# Altium project Francisco Gimenez.PrjPCB (part 3 of 3)

## Sheet Actuator_Section.SchDoc
size A; DocumentNumber: 10; SheetNumber: 10; SheetTotal: 13
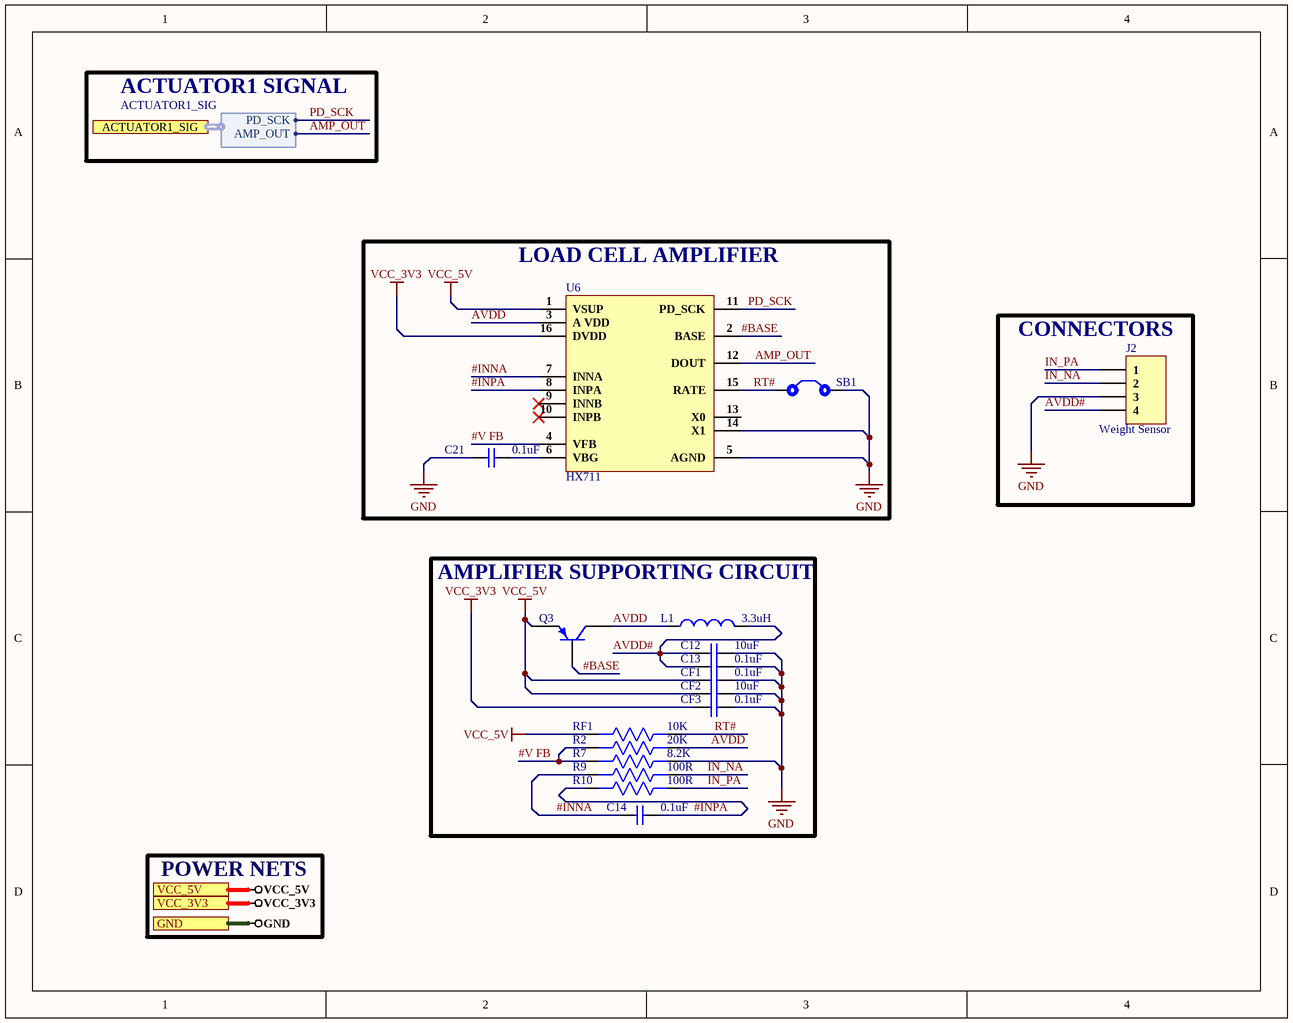
[diagram p8: Actuator_Section.SchDoc]

### Parts
C12  10uF  [CAP-0603]
C13  0.1uF  [CAP-0603]
C14  0.1uF  [CAP-0603]
C21  0.1uF  [CAP-0603]
CF1  0.1uF  [CAP-0603]
CF2  10uF  [CAP-0603]
CF3  0.1uF  [CAP-0603]
J2  Weight Sensor  [B4B-XH-A(LF)(SN)]
L1  3.3uH  [74437368033]
Q3  MMBT4403LT1G  [sot-23]  (value not drawn)
R2  20K  [RES-0603]
R7  8.2K  [RES-0603]
R9  100R  [RES-0603]
R10  100R  [RES-0603]
RF1  10K  [RES-0603]
SB1  Solder Bridge  [Solder Bridge]  (value not drawn)
U6  HX711  [HX711]

### Blocks framed on the sheet
LOAD CELL AMPLIFIER: C21 SB1 U6
CONNECTORS: J2
AMPLIFIER SUPPORTING CIRCUIT: C12-C14 CF1-CF3 L1 Q3 R2 R7 R9 R10 RF1

### Ports
ACTUATOR1_SIG (harness ACTUATOR1_SIG), GND, VCC_3V3, VCC_5V

### Harnesses
ACTUATOR1_SIG: PD_SCK, AMP_OUT

### Nets
GND: C12.2 C13.2 C21.1 CF1.2 CF2.2 CF3.2 J2.3 R7.1 SB1.2 U6.5(AGND) U6.14(X1) ; port GND
VCC_3V3: CF3.1 U6.16(DVDD) ; port VCC_3V3
VCC_5V: CF1.1 CF2.1 Q3.2(E) RF1.2 U6.1(VSUP) ; port VCC_5V
#BASE: Q3.1(B) U6.2(BASE)
#INNA: C14.1 R9.2 U6.7(INNA)
#INPA: C14.2 R10.2 U6.8(INPA)
#V FB: R2.2 R7.2 U6.4(VFB)
AMP_OUT: U6.12(DOUT) ; port ACTUATOR1_SIG.AMP_OUT  [project net ACTUATOR1_SIG.AMP_OUT]
AVDD: L1.1 Q3.3(C) R2.1 U6.3(A_VDD)
AVDD#: C12.1 C13.1 J2.4 L1.2
IN_NA: J2.2 R9.1
IN_PA: J2.1 R10.1
PD_SCK: U6.11(PD_SCK) ; port ACTUATOR1_SIG.PD_SCK  [project net ACTUATOR1_SIG.PD_SCK]
RT#: RF1.1 SB1.1 U6.15(RATE)
NetC21_2: C21.2 U6.6(VBG)

Not connected (* = marked no-connect by the designer): U6 9(INNB)* 10(INPB)* 13(X0)

### Notes on the sheet
- ACTUATOR1 SIGNAL
- POWER NETS

### Library data of the parts
C12 CF2 = TMK107BBJ106MA-T: CAP CER 10UF 25V X5R 0603; Manufacturer: Taiyo Yuden; Tolerance: 20%; Supplier 1: Digi-Key; Manufacturer Part Number: TMK107BBJ106MA-T; Stock 1: 85333; Pricing 1: 1=0.46, 10=0.32, 50=0.2238, 100=0.1918, 500=0.14386, 1000=0.12149 (USD); Mount: Surface Mount; Case/Package: 0603; Case Code (Imperial): 0603; Case Code (Metric): 1608; Min Operating Temperature: -55°C; Max Operating Temperature: 85°C; Packaging: Tape and Reel; Capacitance: 10uF; Voltage Rating: 25V; Lead Free: Lead Free; RoHS Compliant: Yes; ComponentLink1URL: http://ds.yuden.co.jp/TYCOMPAS/ut/detail.do?productNo=TMK107BBJ106MA-T&fileName=TMK107BBJ106MA-T_SS&mode=specSheetDownload&src-supplier=Digi-Key; ComponentLink1Description: http://ds.yuden.co.jp/TYCOMPAS/ut/detail.do?productNo=TMK107BBJ106MA-T&fileName=TMK107BBJ106MA-T_SS&mode=specSheetDownload&src-supplier=Digi-Key; Supplier Part Number 1: 587-6023-1-ND
C13 C14 C21 CF1 CF3 = CL10B104KB8NNNL: CAP CER 0.1UF 50V X7R 0603; Manufacturer: Samsung; Capacitance: 100nF; Tolerance: 10%; Supplier 1: Digi-Key; Manufacturer Part Number: CL10B104KB8NNNL; Stock 1: 3731229; Pricing 1: 1=0.1, 10=0.03, 50=0.0164, 100=0.0134, 500=0.00958, 1000=0.00753, 2500=0.00684, 5000=0.0063 (USD); Mount: Surface Mount; Case/Package: 0603; Min Operating Temperature: -55°C; Max Operating Temperature: 125°C; Dielectric: X7R; Packaging: Tape and Reel; Package Quantity: 15000; Voltage Rating: 50V; Voltage Rating (DC): 50V; Series: CL; Construction: Flat; Length: 1.6mm; Width: 0.031inch; Height: 0.8mm; Thickness: 0.035inch; Depth: 0.8mm; Radiation Hardening: No; RoHS Compliant: Yes; ComponentLink1URL: https://www.verical.com/server-webapp/html/getDatasheet?partID=357523&src-supplier=Verical; ComponentLink1Description: https://www.verical.com/server-webapp/html/getDatasheet?partID=357523&src-supplier=Verical; ComponentLink2URL: https://media.digikey.com/pdf/Data%20Sheets/Samsung%20PDFs/CL_Series_MLCC_ds.pdf?src-supplier=Digi-Key; ComponentLink2Description: https://media.digikey.com/pdf/Data%20Sheets/Samsung%20PDFs/CL_Series_MLCC_ds.pdf?src-supplier=Digi-Key; Supplier Part Number 1: 1276-CL10B104KB8NNNLCT-ND
J2 = B4B-XH-A(LF)(SN): CONN HEADER VERT 4POS 2.5MM; Manufacturer: JST; Current Rating: 3A; Contact Resistance: 20mR; Voltage Rating (AC): 250V; Number of Positions: 4; Insulation Resistance: 1GR; Connector Type: Male Pin; Gender: Male; Wire/Cable Gauge: 22AWG; Supplier 1: Digi-Key; Manufacturer Part Number: B4B-XH-A(LF)(SN); Stock 1: 0; Mount: Through Hole; Contact Material: Brass; Contact Plating: Tin,Copper,Lead; Color: Natural; Housing Color: White; Housing Material: Polyamide; Material: Polyamide; Min Operating Temperature: -25°C; Max Operating Temperature: 85°C; Number of Rows: 1; Max Current Rating: 3A; Package Quantity: 500; Packaging: Bulk; Voltage Rating: 250V; Termination: Press-Fit; Max Voltage Rating (AC): 250V; Max Voltage Rating (DC): 250V; Number of Contacts: 4; Orientation: Straight; Series: XH; Contact Type: Male Pin; Length: 12.4mm; Pitch: 2.5mm; Lead Pitch: 2.5mm; Depth: 5.75mm; REACH SVHC: No SVHC; Lead Free: Lead Free; ComponentLink1URL: http://www.jst-mfg.com/product/pdf/eng/eXH.pdf?src-supplier=Digi-Key; ComponentLink1Description: http://www.jst-mfg.com/product/pdf/eng/eXH.pdf?src-supplier=Digi-Key; ComponentLink2URL: https://www.verical.com/server-webapp/html/getDatasheet?partID=640571&src-supplier=Verical; ComponentLink2Description: https://www.verical.com/server-webapp/html/getDatasheet?partID=640571&src-supplier=Verical; ComponentLink3URL: http://www.jst-mfg.com/product/pdf/eng/eXH.pdf?src-supplier=Future+Electronics; ComponentLink3Description: http://www.jst-mfg.com/product/pdf/eng/eXH.pdf?src-supplier=Future+Electronics; ComponentLink4URL: https://www.verical.com/server-webapp/html/getDatasheet?partID=455616&src-supplier=Verical; ComponentLink4Description: https://www.verical.com/server-webapp/html/getDatasheet?partID=455616&src-supplier=Verical; Supplier Part Number 1: 455-2249-ND
L1 = 74437368033: FIXED IND 3.3UH 8A 11.8 MOHM SMD; Manufacturer: Wurth Electronics; Core Material: Ferrite,Composite; Tolerance: 20%; Saturation Current: 23A; Shielding: Shielded; Self Resonant Frequency: 22MHz; DC Resistance (DCR): 11.8mR; Test Frequency: 100kHz; ComponentLink1URL: http://www.farnell.com/datasheets/1735871.pdf?src-supplier=Element14; ComponentLink1Description: http://www.farnell.com/datasheets/1735871.pdf?src-supplier=Element14; ComponentLink2URL: http://www.mouser.com/ds/2/445/74437368022-538992.pdf?src-supplier=Mouser; ComponentLink2Description: http://www.mouser.com/ds/2/445/74437368022-538992.pdf?src-supplier=Mouser; ComponentLink3URL: http://katalog.we-online.de/pbs/datasheet/74437368022.pdf?src-supplier=Digi-Key; ComponentLink3Description: http://katalog.we-online.de/pbs/datasheet/74437368022.pdf?src-supplier=Digi-Key; ComponentLink4URL: http://documents.rs-components.com/techlib://itc_doclist_GB.htm?stockno=7568629&src-supplier=RSComponents; ComponentLink4Description: http://documents.rs-components.com/techlib://itc_doclist_GB.htm?stockno=7568629&src-supplier=RSComponents; ComponentLink5URL: http://www.produktinfo.conrad.com/datenblaetter/1000000-1099999/001087607-da-01-ml-WE_LHMI_SMD_SPEICHERDROSSEL_744373_de_en.pdf?src-supplier=Conrad; ComponentLink5Description: http://www.produktinfo.conrad.com/datenblaetter/1000000-1099999/001087607-da-01-ml-WE_LHMI_SMD_SPEICHERDROSSEL_744373_de_en.pdf?src-supplier=Conrad; Supplier 1: Digi-Key; Manufacturer Part Number: 74437368033; RoHS: Yes; Category: Fixed Inductors; Stock 1: 1240; Pricing 1: 1=2.41000, 10=2.35900, 50=2.17700, 100=1.99600, 250=1.90500 (USD); Mount: Surface Mount; Case/Package: Nonstandard; Min Operating Temperature: -40°C; Max Operating Temperature: 125°C; Inductance Tolerance: 20%; Package Quantity: 500; Current Rating: 8A; Packaging: Tape and Reel; Resistor Type: Wirewound; Inductance: 3.3uH; Max DC Current: 8A; Termination: SMD/SMT; RMS Current (Irms): 8A; Series: WE-LHMI; Frequency: 22MHz; Series Resistance: 11.8MR; Length: 11mm; Width: 10mm; Height: 3.8mm; Height - Seated (Max): 0.157inch; Depth: 10mm; REACH SVHC: Unknown; RoHS Compliant: Yes; ComponentLink6URL: https://datasheet.ciiva.com/7354/74437368033-7354466.pdf?src-supplier=Newark; ComponentLink6Description: https://datasheet.ciiva.com/7354/74437368033-7354466.pdf?src-supplier=Newark; ComponentLink7URL: https://datasheet.ciiva.com/7691/1735872-7691596.pdf?src-supplier=Element14; ComponentLink7Description: https://datasheet.ciiva.com/7691/1735872-7691596.pdf?src-supplier=Element14; ComponentLink8URL: https://datasheet.ciiva.com/4961/74437368033-89775-4961151.pdf?src-supplier=Mouser; ComponentLink8Description: https://datasheet.ciiva.com/4961/74437368033-89775-4961151.pdf?src-supplier=Mouser; ComponentLink9URL: https://datasheet.ciiva.com/6693/74437368033-6693468.pdf?src-supplier=Digi-Key; ComponentLink9Description: https://datasheet.ciiva.com/6693/74437368033-6693468.pdf?src-supplier=Digi-Key; ComponentLink10URL: https://datasheet.ciiva.com/6693/74437368033-6693470.pdf?src-supplier=Digi-Key; ComponentLink10Description: https://datasheet.ciiva.com/6693/74437368033-6693470.pdf?src-supplier=Digi-Key; ComponentLink11URL: https://datasheet.ciiva.com/6693/74437368033-6693471.pdf?src-supplier=Digi-Key; ComponentLink11Description: https://datasheet.ciiva.com/6693/74437368033-6693471.pdf?src-supplier=Digi-Key; ComponentLink12URL: https://datasheet.ciiva.com/48690/001087608-da-01-ml-we-lhmi-smd-speicherdrossel-744373-de-en-48690487.pdf?src-supplier=Conrad; ComponentLink12Description: https://datasheet.ciiva.com/48690/001087608-da-01-ml-we-lhmi-smd-speicherdrossel-744373-de-en-48690487.pdf?src-supplier=Conrad; Supplier Part Number 1: 732-3388-1-ND
Q3 = MMBT4403LT1G: TRANS PNP 40V 600MA SOT23-3; Manufacturer: ON Semiconductor; Max Power Dissipation: 300mW; hFE Min: 30; Emitter Base Voltage (VEBO): 5V; Transition Frequency: 200MHz; Collector Emitter Saturation Voltage: -750mV; Element Configuration: Single; Voltage Rating (DC): -40V; Current Rating: -600mA; Collector-emitter Voltage-Max: 750mV; Number of Elements: 1; ComponentLink1URL: http://www.onsemi.com/pub/Collateral/MMBT4403LT1-D.PDF?src-supplier=Avnet; ComponentLink1Description: http://www.onsemi.com/pub/Collateral/MMBT4403LT1-D.PDF?src-supplier=Avnet; ComponentLink2URL: http://www.onsemi.com/pub/Collateral/MMBT4403LT1-D.PDF?src-supplier=Digi-Key; ComponentLink2Description: http://www.onsemi.com/pub/Collateral/MMBT4403LT1-D.PDF?src-supplier=Digi-Key; Supplier 1: Avnet; Manufacturer Part Number: MMBT4403LT1G; RoHS: Yes; Category: BJTs; Stock 1: 25249; Pricing 1: 1=0.14200, 10=0.09900, 100=0.05400, 500=0.04300 (USD); Case/Package: SOT-23-3; Number of Pins: 3; Contact Plating: Tin,Matte; Min Operating Temperature: -55°C; Max Operating Temperature: 150°C; Packaging: Tape and Reel; Polarity: PNP; Collector Emitter Breakdown Voltage: 40V; Package Quantity: 1; Collector Emitter Voltage (VCEO): 40V; Max Collector Current: 600mA; Collector Base Voltage (VCBO): 40V; Power Dissipation: 300mW; Gain Bandwidth Product: 200MHz; Max Frequency: 200MHz; Series: -; Frequency: 200MHz; Max Breakdown Voltage: 40V; Length: 3.04mm; Width: 1.4mm; Height: 1.01mm; Radiation Hardening: No; Lead Free: Lead Free; REACH SVHC: No SVHC; RoHS Compliant: Yes; ComponentLink3URL: https://datasheet.ciiva.com/4722/mmbt4403lt1-d-101652-4722132.pdf?src-supplier=Mouser; ComponentLink3Description: https://datasheet.ciiva.com/4722/mmbt4403lt1-d-101652-4722132.pdf?src-supplier=Mouser; ComponentLink4URL: https://datasheet.ciiva.com/15138/getdatasheetpartid-44367-15138750.pdf?src-supplier=Verical; ComponentLink4Description: https://datasheet.ciiva.com/15138/getdatasheetpartid-44367-15138750.pdf?src-supplier=Verical; ComponentLink5URL: https://datasheet.ciiva.com/14546/70099534-14546501.pdf?src-supplier=Allied+Electronics; ComponentLink5Description: https://datasheet.ciiva.com/14546/70099534-14546501.pdf?src-supplier=Allied+Electronics; ComponentLink6URL: https://datasheet.ciiva.com/7972/mmbt4403lt1-d-7972391.pdf?src-supplier=Element14; ComponentLink6Description: https://datasheet.ciiva.com/7972/mmbt4403lt1-d-7972391.pdf?src-supplier=Element14; ComponentLink7URL: https://datasheet.ciiva.com/11198/mmbt4403lt1-d-11198713.pdf?src-supplier=Avnet; ComponentLink7Description: https://datasheet.ciiva.com/11198/mmbt4403lt1-d-11198713.pdf?src-supplier=Avnet; ComponentLink8URL: https://datasheet.ciiva.com/16478/mmbt4403lt1-d-16478554.pdf?src-supplier=Avnet+Asia; ComponentLink8Description: https://datasheet.ciiva.com/16478/mmbt4403lt1-d-16478554.pdf?src-supplier=Avnet+Asia; ComponentLink9URL: https://datasheet.ciiva.com/976/mmbt4403lt1-d-976347.pdf?src-supplier=Digi-Key; ComponentLink9Description: https://datasheet.ciiva.com/976/mmbt4403lt1-d-976347.pdf?src-supplier=Digi-Key; ComponentLink10URL: https://datasheet.ciiva.com/16396/mmbt4403lt1-d-16396635.pdf?src-supplier=Future+Electronics; ComponentLink10Description: https://datasheet.ciiva.com/16396/mmbt4403lt1-d-16396635.pdf?src-supplier=Future+Electronics; ComponentLink11URL: https://datasheet.ciiva.com/976/mmbt4403lt1-d-976348.pdf?src-supplier=Digi-Key; ComponentLink11Description: https://datasheet.ciiva.com/976/mmbt4403lt1-d-976348.pdf?src-supplier=Digi-Key; ComponentLink12URL: https://datasheet.ciiva.com/976/mmbt4403lt1-d-976349.pdf?src-supplier=Digi-Key; ComponentLink12Description: https://datasheet.ciiva.com/976/mmbt4403lt1-d-976349.pdf?src-supplier=Digi-Key; ComponentLink13URL: https://datasheet.ciiva.com/25998/mmbt4403lt1-d-25998110.pdf?src-supplier=Avnet+Europe; ComponentLink13Description: https://datasheet.ciiva.com/25998/mmbt4403lt1-d-25998110.pdf?src-supplier=Avnet+Europe; Supplier Part Number 1: 88H4792
R2 = ESR03EZPF2002: RES SMD 20K OHM 1% 1/4W 0603; Manufacturer: Rohm; Resistance: 20kR; Max Power Dissipation: 250mW; Temperature Coefficient: 100ppm/°C; Supplier 1: Digi-Key; Manufacturer Part Number: ESR03EZPF2002; Stock 1: 4737; Pricing 1: 1=0.13, 10=0.12, 100=0.046, 1000=0.02024, 2500=0.01748 (USD); Case/Package: 0603; Case Code (Metric): 1608; Case Code (Imperial): 0603; Min Operating Temperature: -55°C; Max Operating Temperature: 155°C; Package Quantity: 1; Tolerance: 1%; Packaging: Tape and Reel; Resistor Type: Thick Film; Number of Terminations: 2; Features: Automotive AEC-Q200; Series: ESR; Length: 0.063inch; Width: 0.031inch; Height: 0.022inch; RoHS Compliant: Yes; ComponentLink1URL: https://www.rohm.com/datasheet/ESR01MZPF/esr-e?src-supplier=Digi-Key; ComponentLink1Description: https://www.rohm.com/datasheet/ESR01MZPF/esr-e?src-supplier=Digi-Key; Supplier Part Number 1: RHM20.0KADCT-ND
R7 = ERJ-PA3J822V: RES SMD 8.2K OHM 5% 1/4W 0603; Manufacturer: Panasonic; Resistance: 8.2kR; Max Power Dissipation: 250mW; Temperature Coefficient: 200ppm/°C; Supplier 1: Digi-Key; Manufacturer Part Number: ERJ-PA3J822V; Stock 1: 19862; Pricing 1: 1=0.1, 10=0.09, 100=0.0345, 1000=0.01518, 2500=0.01311 (USD); Case/Package: 0603; Case Code (Metric): 1608; Case Code (Imperial): 0603; Min Operating Temperature: -55°C; Max Operating Temperature: 155°C; Packaging: Tape and Reel; Resistor Type: Thick Film; Number of Terminations: 2; Tolerance: 5%; Features: Automotive AEC-Q200; Length: 0.063inch; Width: 0.031inch; Height: 0.018inch; ComponentLink1URL: https://industrial.panasonic.com/cdbs/www-data/pdf/RDO0000/AOA0000C331.pdf?src-supplier=Digi-Key; ComponentLink1Description: https://industrial.panasonic.com/cdbs/www-data/pdf/RDO0000/AOA0000C331.pdf?src-supplier=Digi-Key; Supplier Part Number 1: P8.2KBZDKR-ND
R9 R10 = RCA0603100RFKEAHP: RES SMD 100 OHM 1% 1/4W 0603; Manufacturer: Vishay Dale; Max Power Dissipation: 250mW; Temperature Coefficient: 100ppm/°C; Supplier 1: Digi-Key; Manufacturer Part Number: RCA0603100RFKEAHP; Stock 1: 0; Case/Package: 0603; Case Code (Imperial): 0603; Case Code (Metric): 1608; Min Operating Temperature: -55°C; Max Operating Temperature: 155°C; Resistor Type: Thick Film; Features: Automotive AEC-Q200,Anti-Sulfur; Packaging: Tape and Reel; Resistance: 100R; Tolerance: 1%; Number of Terminations: 2; RoHS Compliant: Yes; ComponentLink1URL: http://www.vishay.com/docs/20067/rcahp.pdf?src-supplier=Digi-Key; ComponentLink1Description: http://www.vishay.com/docs/20067/rcahp.pdf?src-supplier=Digi-Key; Supplier Part Number 1: 541-3244-2-ND
RF1 = CRGH0603J10K: RES SMD 10K OHM 5% 1/5W 0603; Manufacturer: TE Connectivity Holsworthy; Resistance: 10kR; Temperature Coefficient: 100ppm/°C; Power Rating: 200mW; Voltage Rating: 50V; Number of Resistors: 1; ComponentLink1URL: http://www.farnell.com/datasheets/2167052.pdf?src-supplier=Element14; ComponentLink1Description: http://www.farnell.com/datasheets/2167052.pdf?src-supplier=Element14; ComponentLink2URL: https://www.rohm.com/datasheet/ESR01MZPF/esr-e?src-supplier=Digi-Key; ComponentLink2Description: https://www.rohm.com/datasheet/ESR01MZPF/esr-e?src-supplier=Digi-Key; Supplier 1: Digi-Key; Manufacturer Part Number: CRGH0603J10K; Stock 1: 85818; Pricing 1: 1=0.1, 10=0.049, 100=0.02, 1000=0.00899, 2500=0.0078 (USD); Mount: Surface Mount; Case/Package: 0603; Case Code (Imperial): 0603; Case Code (Metric): 1608; Min Operating Temperature: -55°C; Max Operating Temperature: 125°C; Tolerance: 5%; Packaging: Tape and Reel; Resistor Type: Thick Film,Power resistor; Number of Terminations: 2; Series: CRGH; Termination: Solder; Voltage Rating (DC): 50V; Resistance Tolerance: 5%; Technology: THICK FILM; Length: 1.6mm; Width: 0.8mm; Height: 0.45mm; Depth: 0.8mm; RoHS Compliant: Yes; REACH SVHC: No SVHC; ELV: Compliant; ComponentLink3URL: http://www.farnell.com/datasheets/2007183.pdf?src-supplier=Element14; ComponentLink3Description: http://www.farnell.com/datasheets/2007183.pdf?src-supplier=Element14; Supplier Part Number 1: A126394DKR-ND
SB1 = Solder Bridge: Solder Bridge ON
U6 = HX711: LOAD CELL AMP HX711; Manufacturer Part No: HX711; Package: SOP-16L

## Sheet Actuator_Section2.SchDoc
size A; DocumentNumber: 11; SheetNumber: 11; SheetTotal: 13
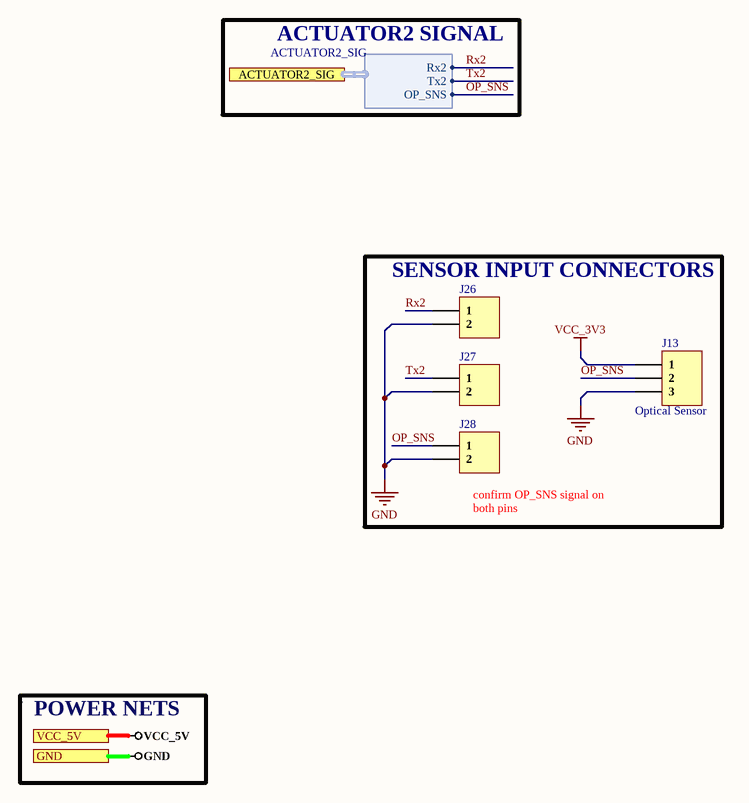
[diagram p9: Actuator_Section2.SchDoc]

### Parts
J13  Optical Sensor  [B3B-XH-A(LF)(SN)]
J26  B2B-XH-A(LF)(SN)  [B2B-XH-A(LF)(SN)]  (value not drawn)
J27  B2B-XH-A(LF)(SN)  [B2B-XH-A(LF)(SN)]  (value not drawn)
J28  B2B-XH-A(LF)(SN)  [B2B-XH-A(LF)(SN)]  (value not drawn)

### Blocks framed on the sheet
SENSOR INPUT CONNECTORS: J13 J26-J28

### Ports
ACTUATOR2_SIG (harness ACTUATOR2_SIG), GND, VCC_5V

### Harnesses
ACTUATOR2_SIG: Rx2, Tx2, OP_SNS

### Nets
GND: J13.3 J26.2 J27.2 J28.2 ; port GND
VCC_3V3: J13.1
OP_SNS: J13.2 J28.1 ; port ACTUATOR2_SIG.OP_SNS  [project net ACTUATOR2_SIG.OP_SNS]
Rx2: J26.1 ; port ACTUATOR2_SIG.Rx2  [project net ACTUATOR2_SIG.Rx2]
Tx2: J27.1 ; port ACTUATOR2_SIG.Tx2  [project net ACTUATOR2_SIG.Tx2]

### Notes on the sheet
- ACTUATOR2 SIGNAL
- (near J28) confirm OP_SNS signal on both pins
- POWER NETS

### Library data of the parts
J13 = B3B-XH-A(LF)(SN): CONN HEADER VERT 3POS 2.5MM; Manufacturer: JST; Current Rating: 3A; Number of Positions: 3; Voltage Rating (AC): 250V; Contact Resistance: 20mR; Insulation Resistance: 1GR; Gender: Male; Wire/Cable Gauge: 22AWG; Supplier 1: Digi-Key; Manufacturer Part Number: B3B-XH-A(LF)(SN); Stock 1: 3453; Pricing 1: 1=0.19, 10=0.181, 25=0.1344, 50=0.1154, 250=0.09612, 750=0.08652, 1000=0.08075, 12000=0.06152, 24000=0.05575 (USD); Mount: Through Hole; Contact Plating: Tin,Lead,Copper; Contact Material: Brass; Color: Natural; Housing Color: White; Housing Material: Polyamide; Contact Shape: Square; Contact Finish - Mating: TIN; Insulation Material: Nylon; Insulation Color: Natural; Min Operating Temperature: -25°C; Max Operating Temperature: 85°C; Number of Rows: 1; Packaging: Bulk; Termination: Solder; Connector Type: Header; Series: XH; Contact Type: Male Pin; Max Current Rating: 3A; Voltage Rating: 250V; Fastening Type: Detent; Number of Contacts: 3; Max Voltage Rating (AC): 250V; Max Voltage Rating (DC): 250V; Orientation: Straight; Length: 9.9mm; Pitch: 2.5mm; Lead Pitch: 2.5mm; Depth: 5.75mm; Lead Free: Lead Free; REACH SVHC: No SVHC; Flammability Rating: UL94 V-0; ComponentLink1URL: https://www.verical.com/server-webapp/html/getDatasheet?partID=640434&src-supplier=Verical; ComponentLink1Description: https://www.verical.com/server-webapp/html/getDatasheet?partID=640434&src-supplier=Verical; ComponentLink2URL: https://www.verical.com/server-webapp/html/getDatasheet?partID=440399&src-supplier=Verical; ComponentLink2Description: https://www.verical.com/server-webapp/html/getDatasheet?partID=440399&src-supplier=Verical; Supplier Part Number 1: 455-2248-ND
J26-J28 = B2B-XH-A(LF)(SN): Conn Shrouded Header (4 Sides) HDR 2 POS 2.5mm Solder ST Thru-Hole Box; Manufacturer: JST; Number of Positions: 2; Connector Type: Male Pin; Current Rating: 3A; Contact Resistance: 20mR; Voltage Rating: 250V; Insulation Resistance: 1GR; Wire/Cable Gauge: 22AWG; Supplier 1: Farnell; Manufacturer Part Number: B2B-XH-A(LF)(SN); RoHS: Yes; Category: FFC / FPC; Stock 1: 219240; Pricing 1: 100=0.06860, 1000=0.04800, 2500=0.04520, 5000=0.04230, 10000=0.03950, 20000=0.03660 (GBP); Mount: Through Hole; Contact Plating: Tin,Copper,Lead; Color: Natural; Contact Material: Brass; Housing Color: White; Housing Material: Polyamide; Min Operating Temperature: -25°C; Max Operating Temperature: 85°C; Number of Rows: 1; Packaging: Bulk; Termination: Solder; Fastening Type: Detent; Max Current Rating: 3A; Voltage Rating (AC): 250V; Max Voltage Rating (AC): 250V; Number of Contacts: 2; Max Voltage Rating (DC): 250V; Orientation: Straight; Length: 7.4mm; Pitch: 2.5mm; Lead Pitch: 2.5mm; Depth: 5.75mm; REACH SVHC: No SVHC; Lead Free: Lead Free; ComponentLink1URL: https://datasheet.ciiva.com/26894/getdatasheetpartid-640357-26894434.pdf?src-supplier=Verical; ComponentLink1Description: https://datasheet.ciiva.com/26894/getdatasheetpartid-640357-26894434.pdf?src-supplier=Verical; ComponentLink2URL: https://datasheet.ciiva.com/11746/0900766b8082653e-11746979.pdf?src-supplier=RSComponents; ComponentLink2Description: https://datasheet.ciiva.com/11746/0900766b8082653e-11746979.pdf?src-supplier=RSComponents; ComponentLink3URL: https://datasheet.ciiva.com/26894/getdatasheetpartid-385291-26894760.pdf?src-supplier=Verical; ComponentLink3Description: https://datasheet.ciiva.com/26894/getdatasheetpartid-385291-26894760.pdf?src-supplier=Verical; ComponentLink4URL: https://datasheet.ciiva.com/8052/5448-8052024.pdf?src-supplier=Element14; ComponentLink4Description: https://datasheet.ciiva.com/8052/5448-8052024.pdf?src-supplier=Element14; ComponentLink5URL: https://datasheet.ciiva.com/20207/523653-20207167.pdf?src-supplier=Rapid+Electronics; ComponentLink5Description: https://datasheet.ciiva.com/20207/523653-20207167.pdf?src-supplier=Rapid+Electronics; Supplier Part Number 1: 1516276

## Sheet Power_Section.SchDoc
size A; DocumentNumber: 5; SheetNumber: 5; SheetTotal: 13
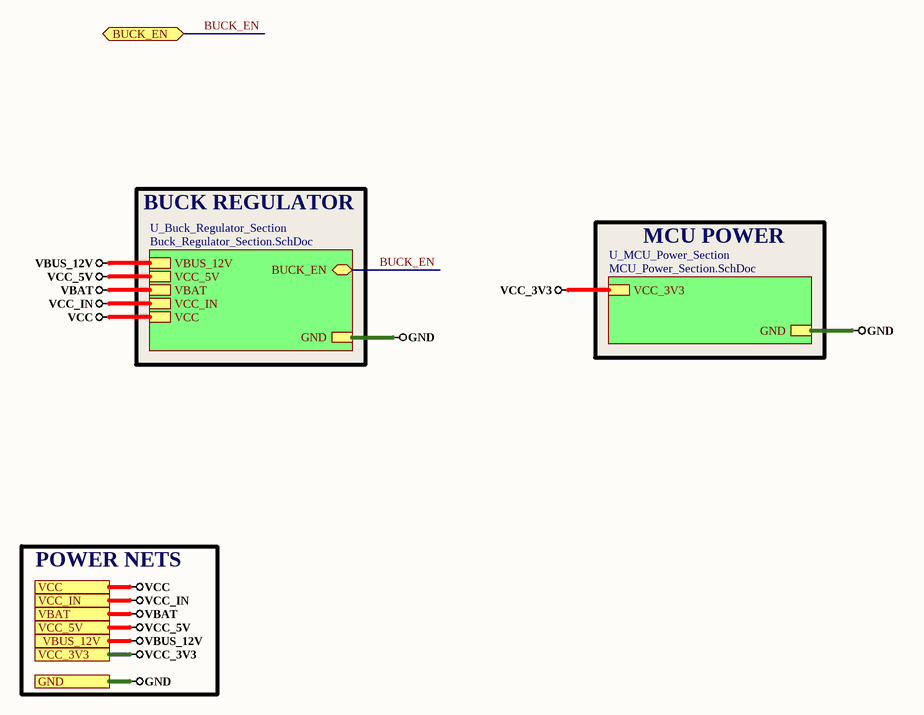
[diagram p10: Power_Section.SchDoc]

### Sub-sheets
U_Buck_Regulator_Section = Buck_Regulator_Section.SchDoc: GND, VBUS_12V, VCC_5V, VBAT, VCC_IN, VCC, BUCK_EN (bidir)
U_MCU_Power_Section = MCU_Power_Section.SchDoc: VCC_3V3, GND

### Ports
BUCK_EN (bidir), GND, VBAT, VBUS_12V, VCC, VCC_3V3, VCC_5V, VCC_IN

### Nets
GND: port GND, sheet U_MCU_Power_Section/GND, sheet U_Buck_Regulator_Section/GND
VBAT: port VBAT, sheet U_Buck_Regulator_Section/VBAT
VBUS_12V: port VBUS_12V, sheet U_Buck_Regulator_Section/VBUS_12V
VCC: port VCC, sheet U_Buck_Regulator_Section/VCC
VCC_3V3: port VCC_3V3, sheet U_MCU_Power_Section/VCC_3V3
VCC_5V: port VCC_5V, sheet U_Buck_Regulator_Section/VCC_5V
VCC_IN: port VCC_IN, sheet U_Buck_Regulator_Section/VCC_IN
BUCK_EN: port BUCK_EN, sheet U_Buck_Regulator_Section/BUCK_EN

### Notes on the sheet
- BUCK REGULATOR
- MCU POWER
- POWER NETS

## Sheet MCU_Power_Section.SchDoc
size A; DocumentNumber: 6; SheetNumber: 6; SheetTotal: 13
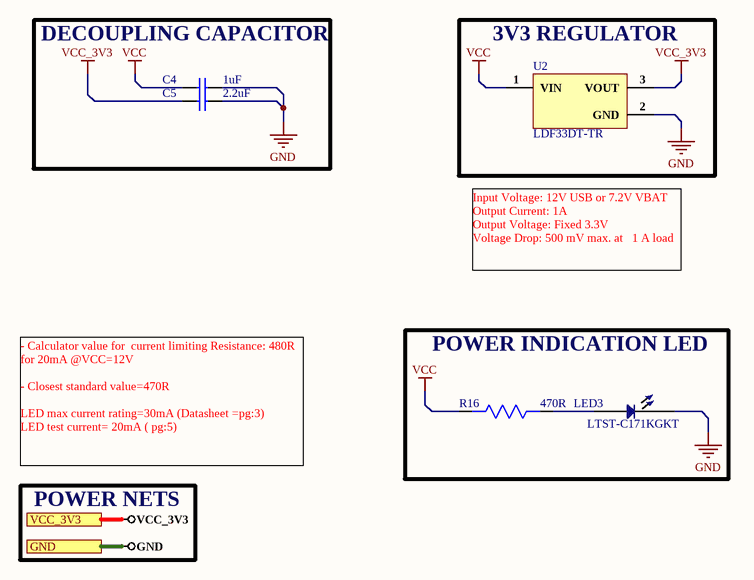
[diagram p11: MCU_Power_Section.SchDoc]

### Parts
C4  1uF  [CAP-0603]
C5  2.2uF  [CAP-0603]
LED3  LTST-C171KGKT  [LED 0805]
R16  470R  [RES-0603]
U2  LDF33DT-TR  [LDF33DT-TR]

### Blocks framed on the sheet
DECOUPLING CAPACITOR: C4 C5
3V3 REGULATOR: U2
POWER INDICATION LED: LED3 R16

### Ports
GND, VCC_3V3

### Nets
GND: C4.2 C5.2 LED3.2 U2.2(GND) ; port GND
VCC: C4.1 R16.2 U2.1(VIN)
VCC_3V3: C5.1 U2.3(VOUT) ; port VCC_3V3
NetLED3_1: LED3.1 R16.1

### Notes on the sheet
- Input Voltage: 12V USB or 7.2V VBAT
  Output Current: 1A
  Output Voltage: Fixed 3.3V
  Voltage Drop: 500 mV max. at   1 A load
- - Calculator value for  current limiting Resistance: 480R for 20mA @VCC=12V
  - Closest standard value=470R
  LED max current rating=30mA (Datasheet =pg:3)
  LED test current= 20mA ( pg:5)
- POWER NETS

### Library data of the parts
C4 = CL10A105KA8NNNC: CAP CER 1UF 25V X5R 0603; Manufacturer: Sams; Tolerance: 10%; Supplier 1: Digi-Key; Manufacturer Part Number: CL10A105KA8NNNC; Stock 1: 2768758; Pricing 1: 1=0.1, 10=0.036, 50=0.0198, 100=0.0161, 500=0.01152, 1000=0.00904 (USD); Mount: Surface Mount; Case/Package: 0603; Min Operating Temperature: -55°C; Max Operating Temperature: 85°C; Capacitance: 1uF; Dielectric: X5R; Voltage Rating (DC): 25V; Voltage: 25V; Length: 1.6mm; Height: 0.8mm; Depth: 0.8mm; Lead Free: Lead Free; Supplier Part Number 1: 1276-1102-1-ND
C5 = CC0603KRX5R8BB225: CAP CER 2.2UF 25V X5R 0603; Manufacturer: Yageo; Tolerance: 10%; Supplier 1: Digi-Key; Manufacturer Part Number: CC0603KRX5R8BB225; Stock 1: 687936; Pricing 1: 1=0.4, 10=0.276, 50=0.1932, 100=0.1656, 500=0.1242, 1000=0.10488 (USD); Mount: Surface Mount; Case/Package: 0603; Case Code (Metric): 1608; Case Code (Imperial): 0603; Weight: 7.1E-05oz; Min Operating Temperature: -55°C; Max Operating Temperature: 85°C; Packaging: Tape and Reel; Capacitance: 2.2uF; Dielectric: X5R; Voltage Rating: 25V; Termination: SMD/SMT; Resistor Type: Ceramic; Voltage Rating (DC): 25V; Package Quantity: 4000; Length: 1.6mm; Width: 0.031inch; Thickness: 0.037inch; Depth: 0.8mm; Radiation Hardening: No; Lead Free: Lead Free; Halogen Free: Halogen Free; RoHS Compliant: Yes; ComponentLink1URL: https://www.verical.com/server-webapp/html/getDatasheet?partID=782757&src-supplier=Verical; ComponentLink1Description: https://www.verical.com/server-webapp/html/getDatasheet?partID=782757&src-supplier=Verical; Supplier Part Number 1: 311-1786-1-ND
LED3 = LTST-C171KGKT: LED GREEN 574nm 2-Pin Chip 0805 SMD; Manufacturer: Vishay Lite-On; Lens Color: Colorless; Viewing Angle: 130°; Lens Style: Rectangular,Diffused,Colorless,Clear; Forward Voltage: 2.4V; Forward Current: 30mA; Luminous Intensity: 35mcd; Dominant Wavelength: 571nm; Test Current: 20mA; Lens Transparency: Clear; Number of Elements: 1; Power Dissipation: 75mW; Reverse Voltage: 5V; Supplier 1: RSComponents; Manufacturer Part Number: LTST-C171KGKT; RoHS: Yes; Category: LEDs; Stock 1: 14250; Pricing 1: 250=0.05900, 500=0.05000, 1250=0.04200, 2500=0.03900 (GBP); Mount: Surface Mount; Case/Package: 0805; Number of Pins: 2; Color: Green; Case Code (Metric): 2012; Case Code (Imperial): 0805; Min Operating Temperature: -55°C; Max Operating Temperature: 85°C; Packaging: Tape and Reel; Package Quantity: 1; Illumination Color: Green; Wavelength: 574nm; Number of LEDs: 1; Power Rating: 75mW; Series: CHIPLED 0805; Length: 2mm; Width: 1.25mm; Height: 0.8mm; Depth: 1.25mm; Radiation Hardening: No; Lead Free: Lead Free; RoHS Compliant: Yes; ComponentLink1URL: https://datasheet.ciiva.com/11774/0900766b80dc0298-11774377.pdf?src-supplier=RSComponents; ComponentLink1Description: https://datasheet.ciiva.com/11774/0900766b80dc0298-11774377.pdf?src-supplier=RSComponents; ComponentLink2URL: https://datasheet.ciiva.com/12400/lite-on-ltst-c171kgkt-187692-12400799.pdf?src-supplier=Mouser; ComponentLink2Description: https://datasheet.ciiva.com/12400/lite-on-ltst-c171kgkt-187692-12400799.pdf?src-supplier=Mouser; ComponentLink3URL: https://datasheet.ciiva.com/16200/lite-on20ltst-c171kgkt-16200100.pdf?src-supplier=Future+Electronics; ComponentLink3Description: https://datasheet.ciiva.com/16200/lite-on20ltst-c171kgkt-16200100.pdf?src-supplier=Future+Electronics; ComponentLink4URL: https://datasheet.ciiva.com/15118/getdatasheetpartid-214542-15118099.pdf?src-supplier=Verical; ComponentLink4Description: https://datasheet.ciiva.com/15118/getdatasheetpartid-214542-15118099.pdf?src-supplier=Verical; ComponentLink5URL: https://datasheet.ciiva.com/2110/s-110-ltst-c171kgkt-2110073.pdf?src-supplier=Digi-Key; ComponentLink5Description: https://datasheet.ciiva.com/2110/s-110-ltst-c171kgkt-2110073.pdf?src-supplier=Digi-Key; ComponentLink6URL: https://datasheet.ciiva.com/2110/s-110-ltst-c171kgkt-2110072.pdf?src-supplier=Digi-Key; ComponentLink6Description: https://datasheet.ciiva.com/2110/s-110-ltst-c171kgkt-2110072.pdf?src-supplier=Digi-Key; ComponentLink7URL: https://datasheet.ciiva.com/2110/s-110-ltst-c171kgkt-2110074.pdf?src-supplier=Digi-Key; ComponentLink7Description: https://datasheet.ciiva.com/2110/s-110-ltst-c171kgkt-2110074.pdf?src-supplier=Digi-Key; Supplier Part Number 1: 6920947P
R16 = ERA3VEB4700V: RES  0.1W, 470½, 0.1%, 0603, RoHS; Manufacturer: Panasonic; Manufacturer Part Number: ERA-3VEB4700V; Supplier 1: Digi-Key; RoHS: No; Category: Chip SMD Resistors; Stock 1: 4950; Pricing 1: 1=0.61000, 10=0.43700, 100=0.22710, 1000=0.12230, 2500=0.11794 (USD); Supplier Part Number 1: 10-ERA-3VEB4700VCT-ND
U2 = LDF33DT-TR: IC REG LINEAR 3.3V 1A DPAK; Manufacturer: STMicroelectronics; Number of Outputs: 1; Min Input Voltage: 2.6V; Max Input Voltage: 16V; Dropout Voltage: 200mV; Polarity: Positive; Quiescent Current: 800uA; Accuracy: 2%; Operating Supply Current: 200uA; Power Supply Rejection Ratio (PSRR): 60dB; Output Type: Fixed; Supplier 1: Digi-Key; Manufacturer Part Number: LDF33DT-TR; Stock 1: 6958; Pricing 1: 1=0.99, 10=0.868, 25=0.8148, 100=0.6178, 250=0.52576, 500=0.49948, 1000=0.434 (USD); Mount: Surface Mount; Case/Package: TO-252-3; Number of Pins: 3; Weight: 0.012346oz; Min Operating Temperature: -40°C; Max Operating Temperature: 125°C; Packaging: Tape and Reel; Max Output Current: 1A; Output Voltage: 3.3V; Nominal Output Voltage: 3.3V; Output Current: 1A; Number of Regulators: 1; Package Quantity: 2500; Radiation Hardening: No; REACH SVHC: No SVHC; Lead Free: Lead Free; RoHS Compliant: Yes; ComponentLink1URL: http://www.st.com/st-web-ui/static/active/en/resource/technical/document/datasheet/DM00099995.pdf?src-supplier=Avnet; ComponentLink1Description: http://www.st.com/st-web-ui/static/active/en/resource/technical/document/datasheet/DM00099995.pdf?src-supplier=Avnet; Supplier Part Number 1: 497-14661-6-ND

## Sheet Buck_Regulator_Section.SchDoc
size A4; DocumentNumber: 7; SheetNumber: 7; SheetTotal: 13
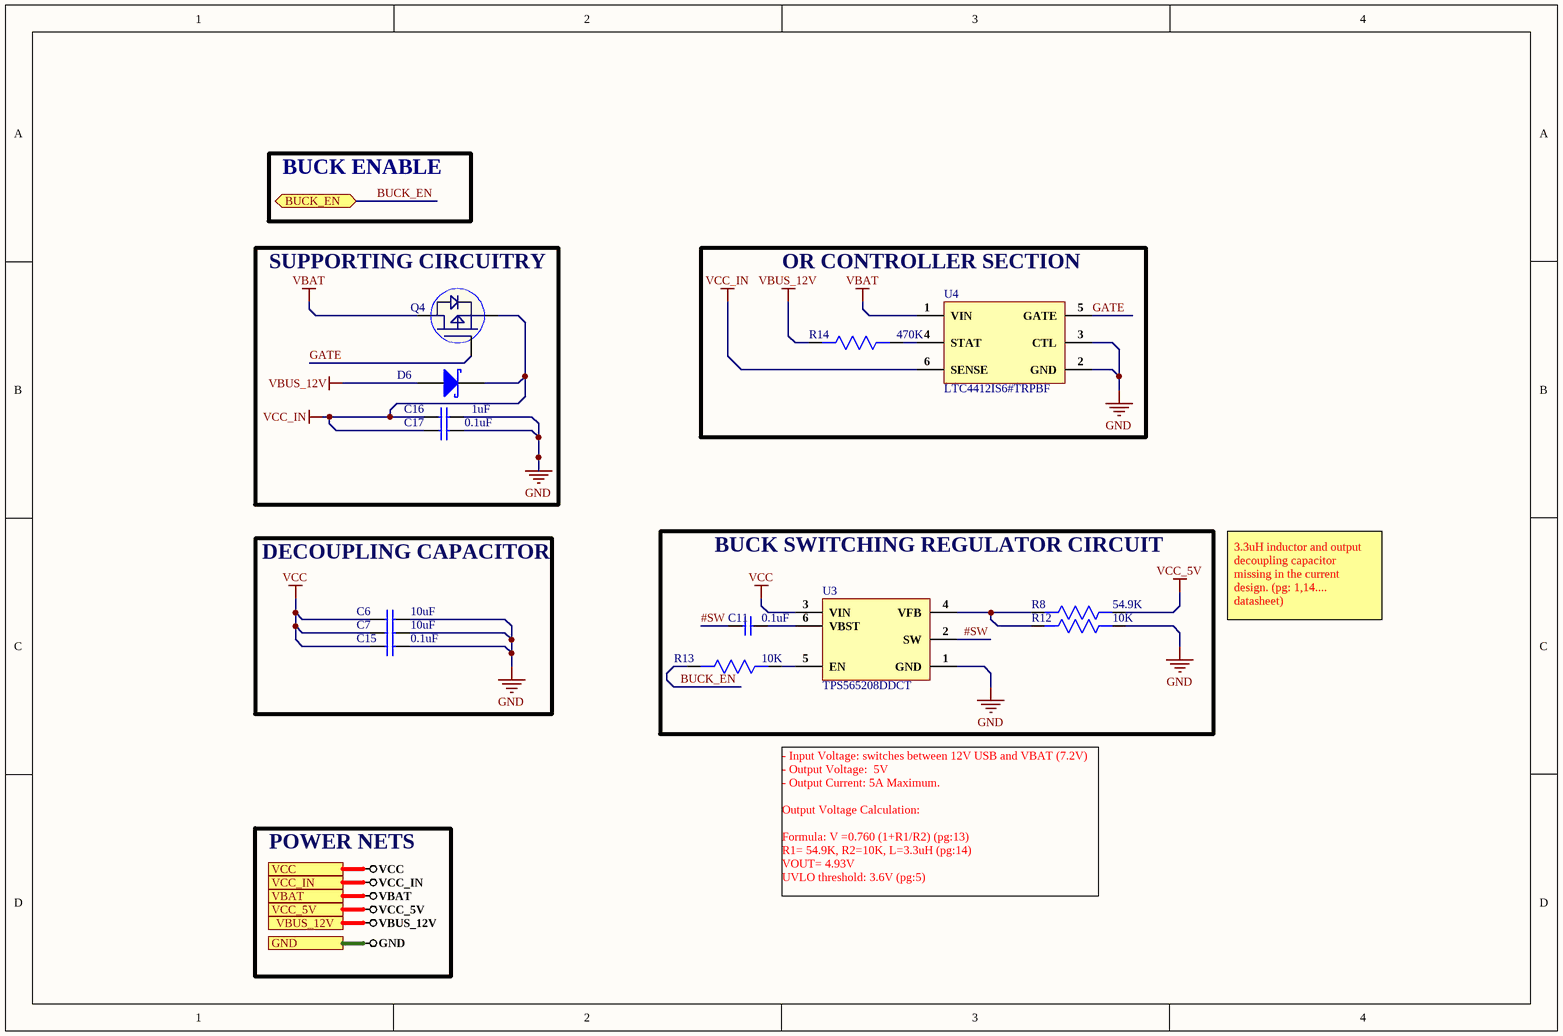
[diagram p12: Buck_Regulator_Section.SchDoc]

### Parts
C6  10uF  [CAP-0603]
C7  10uF  [CAP-0603]
C11  0.1uF  [CAP-0603]
C15  0.1uF  [CAP-0603]
C16  1uF  [CAP-0603]
C17  0.1uF  [CAP-0603]
D6  SS54B-HF  [SMB]  (value not drawn)
Q4  FDN306P  [SuperSOT-3]  (value not drawn)
R8  54.9K  [RES-0603]
R12  10K  [RES-0603]
R13  10K  [RES-0603]
R14  470K  [RES-0603]
U3  TPS565208DDCT  [SOT 23-6]
U4  LTC4412IS6#TRPBF  [TSOT-23-6]

### Blocks framed on the sheet
SUPPORTING CIRCUITRY: C16 C17 D6 Q4
OR CONTROLLER SECTION: R14 U4
DECOUPLING CAPACITOR: C6 C7 C15
BUCK SWITCHING REGULATOR CIRCUIT: C11 R8 R12 R13 U3

### Ports
BUCK_EN (bidir), GND, VBAT, VBUS_12V, VCC, VCC_5V, VCC_IN

### Nets
GND: C6.2 C7.2 C15.2 C16.2 C17.2 R12.1 U3.1(GND) U4.2(GND) U4.3(CTL) ; port GND
VBAT: Q4.3(D) U4.1(VIN) ; port VBAT
VBUS_12V: D6.1 R14.2 ; port VBUS_12V
VCC: C6.1 C7.1 C15.1 U3.3(VIN) ; port VCC
VCC_5V: R8.1 ; port VCC_5V
VCC_IN: C16.1 C17.1 D6.2 Q4.2(S) U4.6(SENSE) ; port VCC_IN
#SW: C11.1 U3.2(SW)
BUCK_EN: R13.2 ; port BUCK_EN
GATE: Q4.1(G) U4.5(GATE)
NetC11_2: C11.2 U3.6(VBST)
NetR8_2: R8.2 R12.2 U3.4(VFB)
NetR13_1: R13.1 U3.5(EN)
NetR14_1: R14.1 U4.4(STAT)

### Notes on the sheet
- BUCK ENABLE
- 3.3uH inductor and output decoupling capacitor missing in the current design. (pg: 1,14.... datasheet)
- POWER NETS
- - Input Voltage: switches between 12V USB and VBAT (7.2V)
  - Output Voltage:  5V
  - Output Current: 5A Maximum.
  Output Voltage Calculation:
  Formula: V =0.760 (1+R1/R2) (pg:13)
  R1= 54.9K, R2=10K, L=3.3uH (pg:14)
  VOUT= 4.93V
  UVLO threshold: 3.6V (pg:5)

### Library data of the parts
C6 C7 = TMK107BBJ106MA-T: as C12 on sheet Actuator_Section; ComponentLink1URL: http://www.farnell.com/datasheets/1824493.pdf?src-supplier=Newark; ComponentLink1Description: http://www.farnell.com/datasheets/1824493.pdf?src-supplier=Newark; ComponentLink2URL: http://www.farnell.com/datasheets/2746429.pdf?src-supplier=Farnell; ComponentLink2Description: http://www.farnell.com/datasheets/2746429.pdf?src-supplier=Farnell; ComponentLink3URL: https://api.kemet.com/component-edge/download/datasheet/C1206C106M3PACTU.pdf?src-supplier=Digi-Key; ComponentLink3Description: https://api.kemet.com/component-edge/download/datasheet/C1206C106M3PACTU.pdf?src-supplier=Digi-Key; ComponentLink4URL: http://www.mouser.com/ds/2/212/KEM_C1006_X5R_SMD-1103249.pdf?src-supplier=Mouser; ComponentLink4Description: http://www.mouser.com/ds/2/212/KEM_C1006_X5R_SMD-1103249.pdf?src-supplier=Mouser; ComponentLink5URL: http://www.farnell.com/datasheets/2746429.pdf?src-supplier=Newark; ComponentLink5Description: http://www.farnell.com/datasheets/2746429.pdf?src-supplier=Newark; ComponentLink6URL: http://www.kemet.com/Lists/ProductCatalog/Attachments/19/KEM_C1006_X5R_SMD.pdf?src-supplier=Avnet; ComponentLink6Description: http://www.kemet.com/Lists/ProductCatalog/Attachments/19/KEM_C1006_X5R_SMD.pdf?src-supplier=Avnet; ComponentLink7URL: http://components.arrow.com/part/dataview/0323_00068823?src-supplier=Arrow+Europe; ComponentLink7Description: http://components.arrow.com/part/dataview/0323_00068823?src-supplier=Arrow+Europe; ComponentLink8URL: http://www.kemet.com/kemet/web/homepage/kechome.nsf/weben/ADB5E2666EC6BA90CA2570A50016092E/$file/KEM_C1005_Y5V_SMD.pdf?src-supplier=Avnet; ComponentLink8Description: http://www.kemet.com/kemet/web/homepage/kechome.nsf/weben/ADB5E2666EC6BA90CA2570A50016092E/$file/KEM_C1005_Y5V_SMD.pdf?src-supplier=Avnet; ComponentLink9URL: http://components.arrow.com/part/dataview/44121590S9544049N7429?src-supplier=Arrow+Electronics; ComponentLink9Description: http://components.arrow.com/part/dataview/44121590S9544049N7429?src-supplier=Arrow+Electronics; ComponentLink10URL: http://ds.yuden.co.jp/TYCOMPAS/ut/detail.do?productNo=TMK107BBJ106MA-T&fileName=TMK107BBJ106MA-T_SS&mode=specSheetDownload&src-supplier=Digi-Key; ComponentLink10Description: http://ds.yuden.co.jp/TYCOMPAS/ut/detail.do?productNo=TMK107BBJ106MA-T&fileName=TMK107BBJ106MA-T_SS&mode=specSheetDownload&src-supplier=Digi-Key; Supplier 1: Digi-Key; Manufacturer Part Number: TMK107BBJ106MA-T; Stock 1: 83542; Pricing 1: 1=0.46, 10=0.32, 50=0.2238, 100=0.1918, 500=0.14386, 1000=0.12149 (USD); Mount: Surface Mount; Case/Package: 0603; Case Code (Imperial): 0603; Case Code (Metric): 1608; Min Operating Temperature: -55°C; Max Operating Temperature: 85°C; Packaging: Tape and Reel; Capacitance: 10uF; Voltage Rating: 25V; Lead Free: Lead Free; RoHS Compliant: Yes; Supplier Part Number 1: 587-6023-6-ND
C11 C15 C17 = CL10B104KB8NNNL: as C13 on sheet Actuator_Section; Supplier 1: Digi-Key; Manufacturer Part Number: CL10B104KB8NNNL; Pricing 1: 1=0.1, 10=0.03, 50=0.0164, 100=0.0134, 500=0.00958, 1000=0.00753, 2500=0.00684, 5000=0.0063 (USD); Mount: Surface Mount; Case/Package: 0603; Min Operating Temperature: -55°C; Max Operating Temperature: 125°C; Dielectric: X7R; Packaging: Tape and Reel; Package Quantity: 15000; Voltage Rating: 50V; Voltage Rating (DC): 50V; Series: CL; Construction: Flat; Length: 1.6mm; Width: 0.031inch; Height: 0.8mm; Thickness: 0.035inch; Depth: 0.8mm; Radiation Hardening: No; RoHS Compliant: Yes; ComponentLink1URL: https://www.verical.com/server-webapp/html/getDatasheet?partID=357523&src-supplier=Verical; ComponentLink1Description: https://www.verical.com/server-webapp/html/getDatasheet?partID=357523&src-supplier=Verical; ComponentLink2URL: https://media.digikey.com/pdf/Data%20Sheets/Samsung%20PDFs/CL_Series_MLCC_ds.pdf?src-supplier=Digi-Key; ComponentLink2Description: https://media.digikey.com/pdf/Data%20Sheets/Samsung%20PDFs/CL_Series_MLCC_ds.pdf?src-supplier=Digi-Key
  C11 C17: Stock 1: 3731229; Supplier Part Number 1: 1276-CL10B104KB8NNNLCT-ND
  C15: Stock 1: 4119803; Supplier Part Number 1: 1276-CL10B104KB8NNNLDKR-ND
C16 = CL10A105KA8NNNC: as C4 on sheet MCU_Power_Section; Supplier 1: Digi-Key; Manufacturer Part Number: CL10A105KA8NNNC; Stock 1: 2768758; Pricing 1: 1=0.1, 10=0.036, 50=0.0198, 100=0.0161, 500=0.01152, 1000=0.00904 (USD); Mount: Surface Mount; Case/Package: 0603; Min Operating Temperature: -55°C; Max Operating Temperature: 85°C; Capacitance: 1uF; Dielectric: X5R; Voltage Rating (DC): 25V; Voltage: 25V; Length: 1.6mm; Height: 0.8mm; Depth: 0.8mm; Lead Free: Lead Free; Supplier Part Number 1: 1276-1102-1-ND
D6 = SS54B-HF: DIODE SCHOTTKY 5A 40V SMB; Manufacturer: Comchip; Supplier 1: Mouser; Manufacturer Part Number: SS54B-HF; RoHS: No; Stock 1: 2862; Pricing 1: 1=0.56000, 10=0.32900, 50=0.32900, 100=0.17100, 1000=0.11900, 10000=0.09000 (USD); Supplier Part Number 1: 750-SS54B-HF
Q4 = FDN306P: MOSFET P-CH 12V 2.6A SUPERSOT3; Manufacturer: ON Semiconductor / Fairchild; Rds On Max: 40mR; Input Capacitance: 1.138nF; Max Power Dissipation: 500mW; Gate to Source Voltage (Vgs): 8V; Number of Elements: 1; Turn-Off Delay Time: 38ns; Turn-On Delay Time: 11ns; Element Configuration: Single; Rise Time: 10ns; Threshold Voltage: -600mV; Drain to Source Breakdown Voltage: -12V; Polarity: P-CHANNEL; Current Rating: -2.6A; Current: 26A; Supplier 1: Digi-Key; Manufacturer Part Number: FDN306P; RoHS: Yes; Category: MOSFETs; Stock 1: 12409; Pricing 1: 1=0.59000, 10=0.50700, 25=0.47360, 100=0.37880, 500=0.29766, 1000=0.23001 (USD); Mount: Surface Mount; Case/Package: TO-236-3; Number of Pins: 3; Contact Plating: Tin,Matte; Min Operating Temperature: -55°C; Max Operating Temperature: 150°C; Packaging: Tape and Reel; Package Quantity: 3000; Drain to Source Voltage (Vdss): 12V; Continuous Drain Current (ID): 2.6A; Drain to Source Resistance: 40mR; Power Dissipation: 500mW; Series: PowerTrench®; Fall Time: 10ns; Nominal Vgs: -600mV; On-State Resistance: 40MR; Drain-source On Resistance-Max: 40MR; Dual Supply Voltage: -12V; Termination: SMD/SMT; Voltage Rating (DC): -12V; Voltage: 12V; Length: 2.92mm; Width: 1.4mm; Height: 0.94mm; Radiation Hardening: No; REACH SVHC: No SVHC; RoHS Compliant: Yes; Lead Free: Lead Free; ComponentLink1URL: https://datasheet.ciiva.com/6383/fdn306p-6383301.pdf?src-supplier=Digi-Key; ComponentLink1Description: https://datasheet.ciiva.com/6383/fdn306p-6383301.pdf?src-supplier=Digi-Key; ComponentLink2URL: https://datasheet.ciiva.com/4439/fdn306p-50876-4439911.pdf?src-supplier=Mouser; ComponentLink2Description: https://datasheet.ciiva.com/4439/fdn306p-50876-4439911.pdf?src-supplier=Mouser; ComponentLink3URL: https://datasheet.ciiva.com/27050/889760-27050636.pdf?src-supplier=Jameco; ComponentLink3Description: https://datasheet.ciiva.com/27050/889760-27050636.pdf?src-supplier=Jameco; ComponentLink4URL: https://datasheet.ciiva.com/14170/fdn306p-eng-tds-14170925.pdf?src-supplier=Distrelec; ComponentLink4Description: https://datasheet.ciiva.com/14170/fdn306p-eng-tds-14170925.pdf?src-supplier=Distrelec; ComponentLink5URL: https://datasheet.ciiva.com/22700/264983-22700885.pdf?src-supplier=Element14; ComponentLink5Description: https://datasheet.ciiva.com/22700/264983-22700885.pdf?src-supplier=Element14; ComponentLink6URL: https://datasheet.ciiva.com/26144/fdn306p-26144214.pdf?src-supplier=Avnet+Europe; ComponentLink6Description: https://datasheet.ciiva.com/26144/fdn306p-26144214.pdf?src-supplier=Avnet+Europe; ComponentLink7URL: https://datasheet.ciiva.com/6383/fdn306p-6383304.pdf?src-supplier=Digi-Key; ComponentLink7Description: https://datasheet.ciiva.com/6383/fdn306p-6383304.pdf?src-supplier=Digi-Key; ComponentLink8URL: https://datasheet.ciiva.com/11175/fdn306p-11175160.pdf?src-supplier=Avnet; ComponentLink8Description: https://datasheet.ciiva.com/11175/fdn306p-11175160.pdf?src-supplier=Avnet; ComponentLink9URL: https://datasheet.ciiva.com/6383/fdn306p-6383306.pdf?src-supplier=Digi-Key; ComponentLink9Description: https://datasheet.ciiva.com/6383/fdn306p-6383306.pdf?src-supplier=Digi-Key; ComponentLink10URL: https://datasheet.ciiva.com/17275/fdn306p-17275114.pdf?src-supplier=Future+Electronics; ComponentLink10Description: https://datasheet.ciiva.com/17275/fdn306p-17275114.pdf?src-supplier=Future+Electronics; ComponentLink11URL: https://datasheet.ciiva.com/22655/fdn306p-22655327.pdf?src-supplier=Element14; ComponentLink11Description: https://datasheet.ciiva.com/22655/fdn306p-22655327.pdf?src-supplier=Element14; Supplier Part Number 1: FDN306PCT-ND
R8 = RC0603FR-0754K9L: RES SMD 54.9K OHM 1% 1/10W 0603; Manufacturer: Yageo; Resistance: 54.9kR; Power Rating: 100mW; Voltage Rating: 50V; Temperature Coefficient: 100ppm/°C; Working Voltage: 75V; Supplier 1: Digi-Key; Manufacturer Part Number: RC0603FR-0754K9L; Stock 1: 178374; Pricing 1: 1=0.1, 10=0.024, 100=0.0097, 1000=0.00436, 2500=0.00378 (USD); Case/Package: 0603; Case Code (Imperial): 0603; Case Code (Metric): 1608; Min Operating Temperature: -55°C; Max Operating Temperature: 155°C; Tolerance: 1%; Packaging: Tape and Reel; Termination: SMD/SMT; Resistor Type: Thick Film; Voltage Rating (DC): 50V; Number of Terminations: 2; Features: Moisture Resistant; Series: RC; Max Power Dissipation: 100mW; Construction: Rectangular; Technology: THICK FILM; Length: 1.6mm; Width: 0.8mm; Height: 0.45mm; Depth: 0.8mm; Military Standard: Not; Lead Free: Lead Free; RoHS Compliant: Yes; ComponentLink1URL: http://www.mouser.com/catalog/specsheets/RC0603.pdf?src-supplier=Mouser; ComponentLink1Description: http://www.mouser.com/catalog/specsheets/RC0603.pdf?src-supplier=Mouser; ComponentLink2URL: https://www.verical.com/server-webapp/html/getDatasheet?partID=37594&src-supplier=Verical; ComponentLink2Description: https://www.verical.com/server-webapp/html/getDatasheet?partID=37594&src-supplier=Verical; Supplier Part Number 1: 311-54.9KHRCT-ND
R12 R13 = CRGH0603J10K: as RF1 on sheet Actuator_Section; ComponentLink1URL: http://www.farnell.com/datasheets/2167052.pdf?src-supplier=Element14; ComponentLink1Description: http://www.farnell.com/datasheets/2167052.pdf?src-supplier=Element14; ComponentLink2URL: https://www.rohm.com/datasheet/ESR01MZPF/esr-e?src-supplier=Digi-Key; ComponentLink2Description: https://www.rohm.com/datasheet/ESR01MZPF/esr-e?src-supplier=Digi-Key; Supplier 1: Digi-Key; Manufacturer Part Number: CRGH0603J10K; Stock 1: 85818; Pricing 1: 1=0.1, 10=0.049, 100=0.02, 1000=0.00899, 2500=0.0078 (USD); Mount: Surface Mount; Case/Package: 0603; Case Code (Imperial): 0603; Case Code (Metric): 1608; Min Operating Temperature: -55°C; Max Operating Temperature: 125°C; Tolerance: 5%; Packaging: Tape and Reel; Resistor Type: Thick Film,Power resistor; Number of Terminations: 2; Series: CRGH; Termination: Solder; Voltage Rating (DC): 50V; Resistance Tolerance: 5%; Technology: THICK FILM; Length: 1.6mm; Width: 0.8mm; Height: 0.45mm; Depth: 0.8mm; RoHS Compliant: Yes; REACH SVHC: No SVHC; ELV: Compliant; ComponentLink3URL: http://www.farnell.com/datasheets/2007183.pdf?src-supplier=Element14; ComponentLink3Description: http://www.farnell.com/datasheets/2007183.pdf?src-supplier=Element14; Supplier Part Number 1: A126394DKR-ND
R14 = AC0603JR-07470KL: RES SMD 470K OHM 5% 1/10W 0603; Manufacturer: Yageo; Resistance: 470kR; Power Rating: 100mW; Voltage Rating: 50V; Temperature Coefficient: 100ppm/°C; ComponentLink1URL: https://datasheet.ciiva.com/11820/0900766b80808d64-11820639.pdf?src-supplier=RSComponents; ComponentLink1Description: https://datasheet.ciiva.com/11820/0900766b80808d64-11820639.pdf?src-supplier=RSComponents; ComponentLink2URL: https://datasheet.ciiva.com/2487/rr-data-sheet-2487286.pdf?src-supplier=Digi-Key; ComponentLink2Description: https://datasheet.ciiva.com/2487/rr-data-sheet-2487286.pdf?src-supplier=Digi-Key; ComponentLink3URL: https://datasheet.ciiva.com/7984/87330-7984374.pdf?src-supplier=Element14; ComponentLink3Description: https://datasheet.ciiva.com/7984/87330-7984374.pdf?src-supplier=Element14; ComponentLink4URL: https://datasheet.ciiva.com/2487/rr-data-sheet-2487287.pdf?src-supplier=Digi-Key; ComponentLink4Description: https://datasheet.ciiva.com/2487/rr-data-sheet-2487287.pdf?src-supplier=Digi-Key; ComponentLink5URL: https://datasheet.ciiva.com/2487/rr-data-sheet-2487288.pdf?src-supplier=Digi-Key; ComponentLink5Description: https://datasheet.ciiva.com/2487/rr-data-sheet-2487288.pdf?src-supplier=Digi-Key; ComponentLink6URL: https://datasheet.ciiva.com/5759/87330-5759049.pdf?src-supplier=Farnell; ComponentLink6Description: https://datasheet.ciiva.com/5759/87330-5759049.pdf?src-supplier=Farnell; Supplier 1: Digi-Key; Manufacturer Part Number: AC0603JR-07470KL; Stock 1: 71; Pricing 1: 1=0.1, 10=0.024, 100=0.0097, 1000=0.0044, 2500=0.0038 (USD); Case/Package: 0603; Case Code (Imperial): 0603; Case Code (Metric): 1608; Weight: 7.1E-05oz; Min Operating Temperature: -55°C; Max Operating Temperature: 155°C; Tolerance: 5%; Packaging: Tape and Reel; Resistor Type: Thick Film; Termination: SMD/SMT; Number of Terminations: 2; Max Power Dissipation: 100mW; Features: Moisture Resistant,Automotive AEC-Q200; Series: AC; Length: 0.063inch; Width: 0.8mm; Height: 0.022inch; RoHS Compliant: Yes; ComponentLink7URL: http://www.mouser.com/ds/2/447/yageodocoutput-1111992.pdf?src-supplier=Mouser; ComponentLink7Description: http://www.mouser.com/ds/2/447/yageodocoutput-1111992.pdf?src-supplier=Mouser; Supplier Part Number 1: YAG3672DKR-ND
U3 = TPS565208DDCT: IC REG BUCK ADJ 5A TSOT23-6; Manufacturer: Texas Instruments; Output Type: Adjustable; Output Configuration: Positive; Number of Outputs: 1; Min Input Voltage: 4.5V; Max Input Voltage: 17V; Min Output Voltage: 760mV; Max Output Voltage: 7V; Switching Frequency: 500kHz; Synchronous Rectifier: Yes; Supplier 1: Digi-Key; Manufacturer Part Number: TPS565208DDCT; Stock 1: 1895; Pricing 1: 1=1.75, 10=1.576, 25=1.4868, 100=1.2666 (USD); Mount: Surface Mount; Case/Package: SOT-23-6; Min Operating Temperature: -40°C; Max Operating Temperature: 125°C; Packaging: Tape and Reel; Output Current: 5A; RoHS Compliant: Yes; ComponentLink1URL: http://www.ti.com/lit/ds/symlink/tps565208.pdf?src-supplier=Farnell; ComponentLink1Description: http://www.ti.com/lit/ds/symlink/tps565208.pdf?src-supplier=Farnell; ComponentLink2URL: http://www.ti.com/lit/ds/symlink/tps565208.pdf?src-supplier=Digi-Key; ComponentLink2Description: http://www.ti.com/lit/ds/symlink/tps565208.pdf?src-supplier=Digi-Key; ComponentLink3URL: http://www.ti.com/lit/ds/symlink/tps565208.pdf?src-supplier=Newark; ComponentLink3Description: http://www.ti.com/lit/ds/symlink/tps565208.pdf?src-supplier=Newark; Supplier Part Number 1: 296-47502-6-ND
U4 = LTC4412IS6#TRPBF: IC OR CTRLR SRC SELECT TSOT23-6; Manufacturer: Analog Devices / Linear Technology; Turn-On Delay Time: 110us; Turn-Off Delay Time: 13us; Operating Supply Current: 15uA; Supplier 1: Digi-Key; Manufacturer Part Number: LTC4412IS6#TRPBF; RoHS: Yes; Category: Uncategorized; Stock 1: 2608; Pricing 1: 1=3.90000, 10=3.50700, 25=3.31520, 100=2.87310, 250=2.72580, 500=2.44584, 1000=2.08500 (USD); Case/Package: SOT-23-6; Number of Pins: 6; Min Operating Temperature: -40°C; Max Operating Temperature: 85°C; Package Quantity: 2500; Packaging: Tape and Reel; Series: PowerPath™; Length: 2.9mm; RoHS Compliant: Yes; ComponentLink1URL: https://datasheet.ciiva.com/1960/1527-1960891.pdf?src-supplier=Digi-Key; ComponentLink1Description: https://datasheet.ciiva.com/1960/1527-1960891.pdf?src-supplier=Digi-Key; Supplier Part Number 1: LTC4412IS6#TRPBFCT-ND

## Nets that join several sheets
GND: Controller_Section (8 pins), Connector_Section (14 pins), Battery_Management_Section (8 pins), LiFePo_Charging_Section (13 pins), Sensor_Section (13 pins), Actuator_Section (11 pins), Actuator_Section2 (J13.3 J26.2 J27.2 J28.2), MCU_Power_Section (C4.2 C5.2 LED3.2 U2.2), Buck_Regulator_Section (9 pins)
VBAT: Battery_Management_Section (5 pins), Buck_Regulator_Section (Q4.3 U4.1)
VBAT_IN: Connector_Section (J3.1), Battery_Management_Section (7 pins), LiFePo_Charging_Section (7 pins)
VBUS_12V: Connector_Section (J16.A4 J16.A9 J16.B4 J16.B9), LiFePo_Charging_Section (D1.2), Buck_Regulator_Section (D6.1 R14.2)
VCC: Connector_Section (J30.2), MCU_Power_Section (C4.1 R16.2 U2.1), Buck_Regulator_Section (C6.1 C7.1 C15.1 U3.3)
VCC_3V3: Controller_Section (5 pins), Sensor_Section (J1.1 J14.1 J15.1), Actuator_Section (CF3.1 U6.16), Actuator_Section2 (J13.1), MCU_Power_Section (C5.1 U2.3)
VCC_5V: Sensor_Section (6 pins), Actuator_Section (5 pins), Buck_Regulator_Section (R8.1)
VCC_IN: Connector_Section (J30.1), Buck_Regulator_Section (5 pins)
ACTUATOR1_SIG.AMP_OUT: Controller_Section (U1.9), Actuator_Section (U6.12)
ACTUATOR1_SIG.PD_SCK: Controller_Section (U1.8), Actuator_Section (U6.11)
ACTUATOR2_SIG.OP_SNS: Controller_Section (U1.6), Actuator_Section2 (J13.2 J28.1)
ACTUATOR2_SIG.Rx2: Controller_Section (U1.27), Actuator_Section2 (J26.1)
ACTUATOR2_SIG.Tx2: Controller_Section (U1.28), Actuator_Section2 (J27.1)
BUCK_EN: Controller_Section (U1.7), Buck_Regulator_Section (R13.2)
DTR: Controller_Section (Q2.2 R3.2), Connector_Section (J16.A2 J16.B2)
MISO: Controller_Section (U1.31), Sensor_Section (J1.2 J14.2 J15.2 J17.1)
MOSI: Controller_Section (U1.37), Sensor_Section (J1.3 J14.3 J15.3 J17.2)
RFID_SIG.RST1: Controller_Section (U1.36), Sensor_Section (J14.5 P1.1)
RFID_SIG.RST2: Controller_Section (U1.33), Sensor_Section (J15.5 P2.1)
RFID_SIG.SCK: Controller_Section (U1.30), Sensor_Section (J1.4 J14.4 J15.4 J17.3)
RFID_SIG.SS1: Controller_Section (U1.16), Sensor_Section (J14.6 P3.1)
RFID_SIG.SS2: Controller_Section (U1.23), Sensor_Section (J15.6 P4.1)
RTS: Controller_Section (Q1.2 R4.2), Connector_Section (J16.A10 J16.B10)
RXD: Controller_Section (U1.34), Connector_Section (J16.A6 J16.B6)
SENSOR_SIG.SNS_1: Controller_Section (U1.11), Sensor_Section (J29.1 U8.2)
SENSOR_SIG.SNS_2: Controller_Section (U1.12), Sensor_Section (J24.1 U7.2)
SENSOR_SIG.SNS_3: Controller_Section (U1.29), Sensor_Section (J25.1 U19.2)
TXD: Controller_Section (U1.35), Connector_Section (J16.A7 J16.B7)